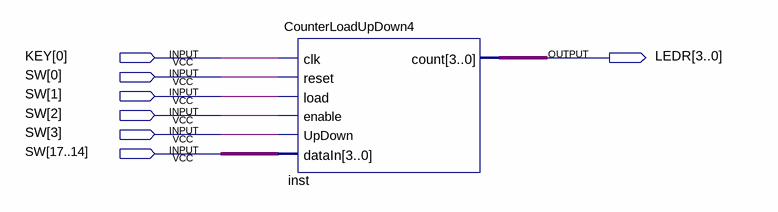
[diagram p0: schematic sheet]
// Quartus schematic Counter_Demo_new.bdf as structural Verilog: 1 symbols, 7 pins
module Counter_Demo_new (
  input  [0:0] KEY,
  input  [17:0] SW,
  output [3:0] LEDR
);

  CounterLoadUpDown4 inst (
    .clk(KEY[0]), .reset(SW[0]), .load(SW[1]), .enable(SW[2]), .UpDown(SW[3]), .dataIn(SW[17:14]),
    .count(LEDR));
endmodule
